# EasyEDA Pro project v0.9.0.epro, board PCB5_10
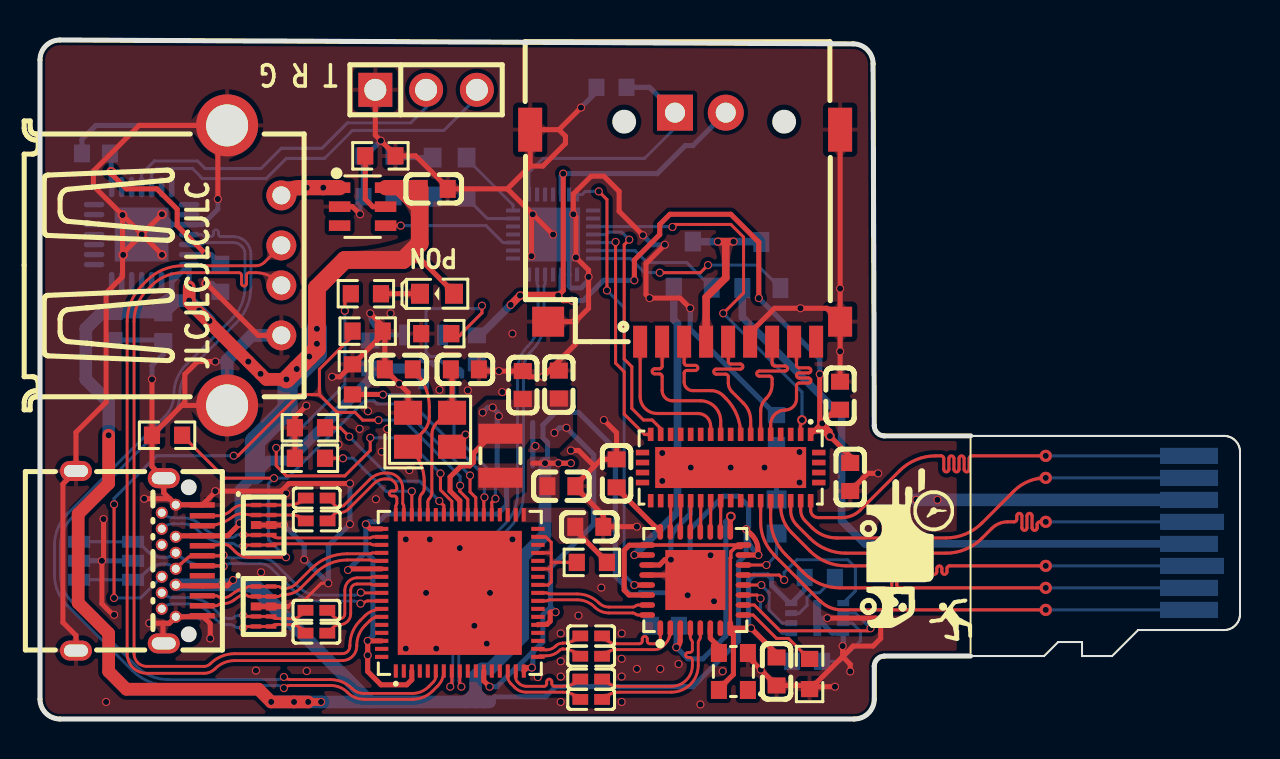
[diagram p2: board, top side]
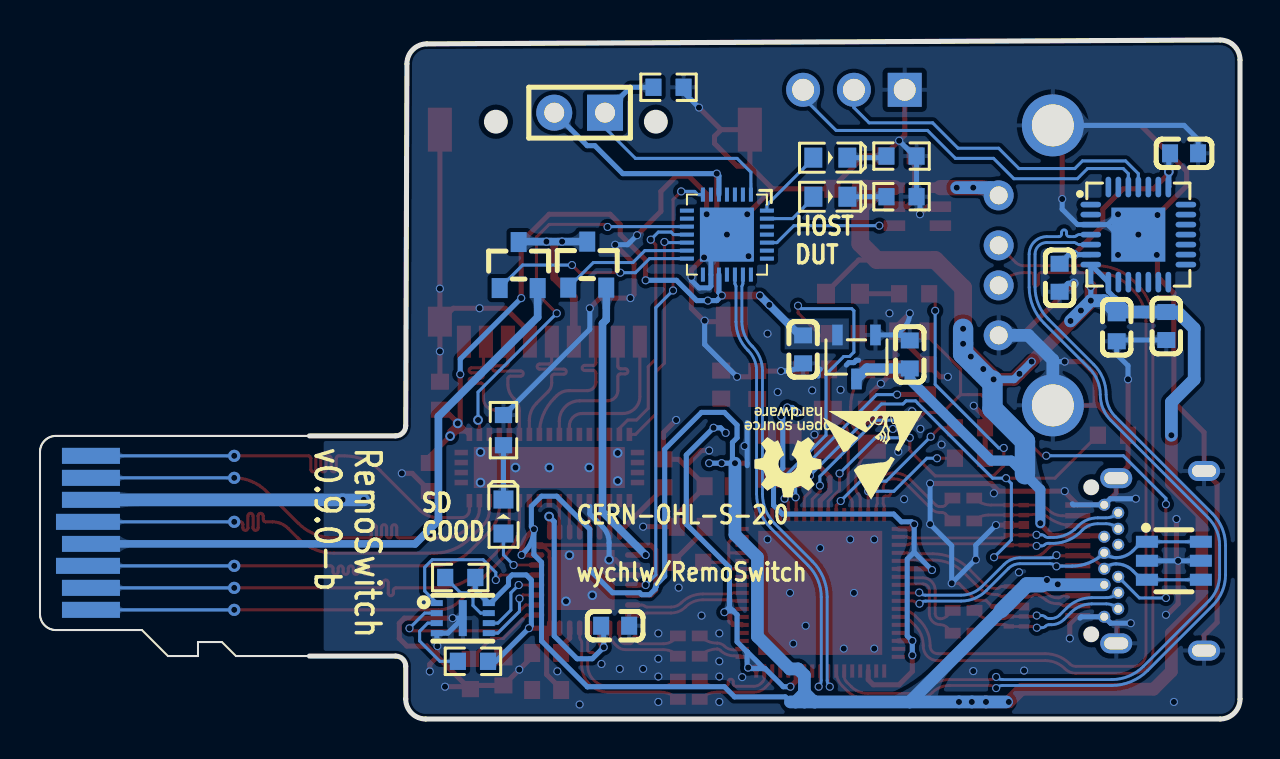
[diagram p3: board, bottom side, seen from below]

Outline 60.01 x 33.95 mm; copper layers: Top Layer, 内层1, 内层2, Bottom Layer. Coordinates in mm from the lower left corner of the outline.
Outline path: 46.53,14.16 42.23,14.16 arc(41.87,14.3) 41.72,14.66 41.66,32.76 arc(41.37,33.46) 40.66,33.76 1,33.95 arc(0.29,33.66) 0,32.95 0,1 arc(0.29,0.29) 1,0 40.72,0 arc(41.43,0.29) 41.72,1 41.72,2.64 arc(41.87,3) 42.23,3.15 46.53,3.15
Stack: Top Layer 0.035mm 外层铜厚1oz / Dielectric1 0.0994mm 3313 RC57% 4.2mil / 内层1 0.0152mm 内层铜厚 / Dielectric2 0.5mm 0.5mm H/HOZ 不含铜  / 内层2 0.0152mm 内层铜厚 / Dielectric3 0.0994mm 3313 RC57% 4.2mil / Bottom Layer 0.035mm 外层铜厚1oz

## Design rules (mm)
net RD_TX+: RD_TX
net RD_TX-: RD_TX
net RD_RX+: RD_RX
net RD_RX-: RD_RX
net RD_D-: RD_D
net RD_D+: RD_D
net HS_D-: HS_D
net HS_D+: HS_D
net SER_D-: SER_D
net SER_D+: SER_D
net UP_D-: UP_D
net UP_D+: UP_D
net UP_TX2-: UP_TX2
net UP_RX2+: UP_RX2
net UP_TX2+: UP_TX2
net UP_RX2-: UP_RX2
net UP_TX1-: UP_TX1
net UP_TX1+: UP_TX1
net BRD_D+: BRD_D
net BRD_D-: BRD_D
net UP_RX1+: UP_RX1
net UP_RX1-: UP_RX1
net $2N12812: DP1
net $2N12808: DP1
net $2N12884: DP2
net $2N12880: DP2
net $2N14098: DP4
net $2N14097: DP4
net $2N14148: DP3
net $2N14147: DP3
template: 自定义配置
spacing copperThickness1oz (default): track to track 0.102, other pairs 0.102 to 0.3
spacing copperThickness2oz: track to track 0.203, other pairs 0.152 to 0.3
track width copperThickness1oz (default): min 0.127, default 0.254, max 2.54
track width copperThickness2oz: min 0.203, default 0.254, max 2.54
track width TFP: min 0.157, default 0.157, max 0.157
differential pair differentialPair (default): width min 0.127, default 0.142, max 0.152; gap min 0.152, default 0.152
differential pair differentialPair3.0: width min 0.127, default 0.142, max 0.152; gap min 0.152, default 0.152
differential pair differentialPair4: width min 0.127, default 0.142, max 2.54; gap min 0.152, default 0.152
via viaSize (default): diameter min 0.356, default 0.404, max 10; hole min 0.3, default 0.305, max 6.299
net RD_TX+ uses differentialPair3.0
net RD_TX- uses differentialPair3.0
net TF_DAT1 uses TFP, TF_MUX
net TF_DAT0 uses TFP, TF_MUX
net TF_CLK uses TFP, TF_MUX
net TF_CMD uses TFP, TF_MUX
net TF_DAT3 uses TFP, TF_MUX
net TF_DAT2 uses TFP, TF_MUX
net RD_RX+ uses differentialPair3.0
net RD_RX- uses differentialPair3.0
net UP_DAT1 uses MUX_TS, TFP
net UP_DAT0 uses MUX_TS, TFP
net UP_CLK uses MUX_TS, TFP
net UP_CMD uses MUX_TS, TFP
net UP_DAT3 uses MUX_TS, TFP
net UP_DAT2 uses MUX_TS, TFP
net TS_DAT1 uses MUX_DUT, TFP
net TS_DAT0 uses MUX_DUT, TFP
net TS_CLK uses MUX_DUT, TFP
net TS_CMD uses MUX_DUT, TFP
net TS_DAT3 uses MUX_DUT, TFP
net TS_DAT2 uses MUX_DUT, TFP
net UP_D- uses differentialPair4
net UP_D+ uses differentialPair4
net UP_TX2- uses differentialPair3.0
net UP_RX2+ uses differentialPair3.0
net UP_TX2+ uses differentialPair3.0
net UP_RX2- uses differentialPair3.0
net UP_TX1- uses differentialPair3.0
net UP_TX1+ uses differentialPair3.0
net UP_RX1+ uses differentialPair3.0
net UP_RX1- uses differentialPair3.0
net $2N12812 uses differentialPair3.0
net $2N12808 uses differentialPair3.0
net $2N12884 uses differentialPair3.0
net $2N12880 uses differentialPair3.0
net $2N14098 uses differentialPair3.0
net $2N14097 uses differentialPair3.0
net $2N14148 uses differentialPair3.0
net $2N14147 uses differentialPair3.0
diff pair RD_TX uses differentialPair3.0
diff pair RD_RX uses differentialPair3.0
diff pair UP_D uses differentialPair4
diff pair UP_TX2 uses differentialPair3.0
diff pair UP_RX2 uses differentialPair3.0
diff pair UP_TX1 uses differentialPair3.0
diff pair UP_RX1 uses differentialPair3.0
diff pair DP1 uses differentialPair3.0
diff pair DP2 uses differentialPair3.0
diff pair DP4 uses differentialPair3.0
diff pair DP3 uses differentialPair3.0

## Placement (name value [footprint] x y rotation side)
C36  100nF  [C0603]  28.83 12.28 90 top
C41  100nF  [C0603]  36.83 2.38 270 top
C42  100nF  [C0603]  31.25 4.66 0 bottom
C45  100nF  [C0603]  40.01 16.16 270 top
C46  100nF  [C0603]  40.52 12.1 90 top
C74  100nF  [C0402]  13.82 5.44 0 top
C75  100nF  [C0402]  13.82 4.29 0 top
C84  100nF  [C0603]  6.16 19.59 90 bottom
C85  100nF  [C0603]  3.69 19.65 270 bottom
C86  100nF  [C0603]  2.8 28.28 0 bottom
C92  10uF  [C0603]  19.69 26.51 0 top
C93  10uF  [C0603]  21.85 18.48 90 bottom
C94  10uF  [C0603]  16.51 18.23 270 bottom
C95  100nF  [C0603]  9.02 22.06 90 bottom
C96  1uF  [C0603]  26.07 11.64 0 top
C97  1uF  [C0603]  24.14 16.7 90 top
C98  10uF  [C0603]  25.95 16.72 90 top
C99  1uF  [C0603]  27.47 9.61 0 top
C100  20pF  [C0603]  17.94 17.48 0 top
C101  20pF  [C0603]  21.25 17.48 0 top
C102  100nF  [C0402]  13.84 11.05 0 top
C103  100nF  [C0402]  13.84 9.9 0 top
C104  100nF  [C0402]  27.56 2 0 top
C105  100nF  [C0402]  27.56 0.98 0 top
C106  100nF  [C0402]  27.56 4.16 0 top
C107  100nF  [C0402]  27.56 3.14 0 top
CARD1  TF PUSH  [TF-SMD_TF-PUSH]  32.26 24.17 180 top
H2  -  [HDR-TH_3P-P2.54-V-M]  19.31 31.46 0 top
H4  -  [HDR-TH_2P-P2.54-V-M-1]  33.02 30.32 0 bottom
L2  2.2uH  [IND-SMD_L2.5-W2.0_MHCHL2520]  23.02 13.16 90 top
LED11  LED-0603_R  [LED0603_RED]  36.83 10.12 90 bottom
LED12  LED-0603_R  [LED0603_RED]  20.48 26.11 180 bottom
LED13  LED-0603_R  [LED0603_RED]  20.49 28.07 180 bottom
LED15  LED-0603_R  [LED0603_RED]  19.85 21.26 180 top
Q2  AO3401A  [SOT-23_L2.9-W1.3-P1.90-LS2.4-BR]  32.64 22.72 270 bottom
Q3  AO3401A  [SOT-23_L2.9-W1.3-P1.90-LS2.4-BR]  36.07 22.7 270 bottom
R26  680  [R0603]  38.48 2.25 90 top
R39  1K  [R0603]  16.93 28.15 180 bottom
R40  1K  [R0603]  16.93 26.11 180 bottom
R41  10K  [R0603]  28.58 31.59 180 bottom
R43  22K  [R0603]  17.02 28.16 180 top
R44  1K  [R0603]  36.83 14.44 90 bottom
R52  1K  [R0603]  27.6 7.83 180 top
R54  1K  [R0603]  16.3 21.26 180 top
R55  10K  [R0603]  13.5 13.04 180 top
R56  10K  [R0603]  13.5 14.56 180 top
R57  5.1K  [R0603]  16.39 19.39 0 top
R58  5.1K  [R0603]  6.35 14.19 180 top
R59  5.1K  [R0603]  15.62 16.98 90 top
R62  10K  [R0603]  38.36 2.88 0 bottom
R63  10K  [R0603]  38.99 7.08 180 bottom
R64  NC  [R0603]  19.82 19.27 180 top
U2  GL3224-OIY04  [HQFN-32_L5.0-W5.0-P0.50-BL-EP3.0]  32.77 6.95 0 top
U3  TS3DV642A0RUAR  [WFQFN-42_L9.0-W3.5-P0.50-BL-EP]  34.54 12.57 180 top
U9  TF卡插头  [TF卡封装]  57.53 9.31 180 top
U23  ESD7104MUTAG  [DFN-10_L2.5-W1.0-P0.50-BL]  11.18 5.63 270 top
U24  ESD7104MUTAG  [DFN-10_L2.5-W1.0-P0.50-BL]  11.19 9.7 270 top
U25  USBLC6-2SC6-ES  [SOT-23-6_L2.9-W1.6-P0.95-LS2.8-BR]  3.31 7.91 0 bottom
U27  CH32V203G6U6  [QFN-28_L4.0-W4.0-P0.40-BL-EP2.7]  25.66 24.22 0 bottom
U29  CH217K  [SOT-23-6_L2.9-W1.6-P0.95-LS2.8-BL]  16.13 25.62 270 top
U30  ME6210A33M3G  [SOT-23-3_L3.0-W1.7-P0.95-LS2.9-BR]  19.18 18.1 90 bottom
U31  CH9102X  [TQFN-28_L5.0-W5.0-P0.50-BL-EP2.7]  5.08 24.22 270 bottom
U33  CH634X  [QFN-68_L8.0-W8.0-P0.40-BL-EP6.2]  20.99 6.31 0 top
U34  W25X20CLUXIG-TR  [USON8_L3.0-W2.0-P0.50-TL-EP]  38.87 5.04 180 bottom
USB2  -  [USB_ Type-A]  6.61 22.7 270 top
USB3  TYPE-C 24P QCHT  [TYPE-C-SMD_TYPE-C-24P-QCHT]  4.96 7.91 270 top
X6  25MHz  [OSC-SMD_4P-L2.5-W2.0-BL-1]  34.67 2.38 90 top
X10  24MHz  [CRYSTAL-SMD_4P-L3.2-W2.5-BL]  19.51 14.46 0 top

## Footprints (pads in the part's own frame, mm; a bottom-side part is the same pattern mirrored in y, then rotated)
C0402
  rect 0.79x0.54 smd: 1(-0.545,0) 2(0.545,0)
C0603
  rect 0.8x0.9 smd: 1(-0.7,0) 2(0.7,0)
CRYSTAL-SMD_4P-L3.2-W2.5-BL
  rect 1.4x1.2 smd: 1(-1.1,-0.85) 2(1.1,-0.85) 3(1.1,0.85) 4(-1.1,0.85)
DFN-10_L2.5-W1.0-P0.50-BL
  rect 0.22x0.52 smd: 1(-1,-0.381) 2(-0.5,-0.381) 4(0.5,-0.381) 5(1,-0.381) 6(1,0.381) 7(0.5,0.381) 9(-0.5,0.381) 10(-1,0.381)
  rect 0.4x0.52 smd: 3(0,-0.381) 8(0,0.381)
HDR-TH_2P-P2.54-V-M-1
  rect 1.8x1.8 hole 1: 1(-1.27,0)
  round 1.8 hole 1: 2(1.27,0)
HDR-TH_3P-P2.54-V-M
  rect 1.7x1.7 hole 1.1: 1(-2.54,0)
  round 1.7 hole 1.1: 2(0,0) 3(2.54,0)
HQFN-32_L5.0-W5.0-P0.50-BL-EP3.0
  oval 0.28x0.785 smd: 1(-1.75,-2.408) 2(-1.25,-2.408) 3(-0.75,-2.408) 4(-0.25,-2.408) 5(0.25,-2.408) 6(0.75,-2.408) 7(1.25,-2.408) 8(1.75,-2.408) 17(1.75,2.408) 18(1.25,2.408) 19(0.75,2.408) 20(0.25,2.408) 21(-0.25,2.408) 22(-0.75,2.408) 23(-1.25,2.408) 24(-1.75,2.408)
  oval 0.785x0.28 smd: 9(2.408,-1.75) 10(2.408,-1.25) 11(2.408,-0.75) 12(2.408,-0.25) 13(2.408,0.25) 14(2.408,0.75) 15(2.408,1.25) 16(2.408,1.75) 25(-2.408,1.75) 26(-2.408,1.25) 27(-2.408,0.75) 28(-2.408,0.25) 29(-2.408,-0.25) 30(-2.408,-0.75) 31(-2.408,-1.25) 32(-2.408,-1.75)
  rect 3x3 smd: 33(0,0)
IND-SMD_L2.5-W2.0_MHCHL2520
  rect 1x2.2 smd: 1(-1.1,0) 2(1.1,0)
LED0603_RED
  rect 0.9x1 smd: 1(-0.85,0) 2(0.85,0)
OSC-SMD_4P-L2.5-W2.0-BL-1
  rect 0.9x0.8 smd: 1(-0.925,-0.725) 2(0.925,-0.725) 3(0.925,0.725) 4(-0.925,0.725)
QFN-28_L4.0-W4.0-P0.40-BL-EP2.7
  rect 0.2x0.7 smd: 1(-1.2,-2) 2(-0.8,-2) 3(-0.4,-2) 4(-0.001,-2) 5(0.4,-2) 6(0.8,-2) 7(1.2,-2) 15(1.2,2) 16(0.8,2) 17(0.4,2) 18(0,2) 19(-0.4,2) 20(-0.8,2) 21(-1.2,2)
  rect 0.7x0.2 smd: 8(2,-1.2) 9(2,-0.8) 10(2,-0.4) 11(1.999,0) 12(2,0.4) 13(2,0.8) 14(2,1.2) 22(-2,1.2) 23(-2,0.8) 24(-2,0.4) 25(-2,0) 26(-2,-0.4) 27(-2,-0.8) 28(-2,-1.2)
  rect 2.7x2.7 smd: 29(0.001,0)
QFN-68_L8.0-W8.0-P0.40-BL-EP6.2
  rect 0.2x0.665 smd: 1(-3.2,-3.908) 2(-2.8,-3.908) 3(-2.4,-3.908) 4(-2,-3.908) 5(-1.6,-3.908) 6(-1.2,-3.908) 7(-0.8,-3.908) 8(-0.4,-3.908) 9(0,-3.908) 10(0.4,-3.908) 11(0.8,-3.908) 12(1.2,-3.908) 13(1.6,-3.908) 14(2,-3.908) 15(2.4,-3.908) 16(2.8,-3.908) 17(3.2,-3.908) 35(3.2,3.908) 36(2.8,3.908) 37(2.4,3.908) 38(2,3.908) 39(1.6,3.908) 40(1.2,3.908) 41(0.8,3.908) 42(0.4,3.908) 43(0,3.908) 44(-0.4,3.908) 45(-0.8,3.908) 46(-1.2,3.908) 47(-1.6,3.908) 48(-2,3.908) 49(-2.4,3.908) 50(-2.8,3.908) 51(-3.2,3.908)
  rect 0.665x0.2 smd: 18(3.908,-3.2) 19(3.908,-2.8) 20(3.908,-2.4) 21(3.908,-2) 22(3.908,-1.6) 23(3.908,-1.2) 24(3.908,-0.8) 25(3.908,-0.4) 26(3.908,0) 27(3.908,0.4) 28(3.908,0.8) 29(3.908,1.2) 30(3.908,1.6) 31(3.908,2) 32(3.908,2.4) 33(3.908,2.8) 34(3.908,3.2) 52(-3.908,3.2) 53(-3.908,2.8) 54(-3.908,2.4) 55(-3.908,2) 56(-3.908,1.6) 57(-3.908,1.2) 58(-3.908,0.8) 59(-3.908,0.4) 60(-3.908,0) 61(-3.908,-0.4) 62(-3.908,-0.8) 63(-3.908,-1.2) 64(-3.908,-1.6) 65(-3.908,-2) 66(-3.908,-2.4) 67(-3.908,-2.8) 68(-3.908,-3.2)
  rect 6.2x6.2 smd: 69(0,0)
R0603
  rect 0.806x0.864 smd: 1(-0.753,0) 2(0.753,0)
SOT-23-3_L3.0-W1.7-P0.95-LS2.9-BR
  rect 1.038x0.532 smd: 1(1.101,-0.95) 2(1.101,0.95) 3(-1.101,0)
SOT-23-6_L2.9-W1.6-P0.95-LS2.8-BL
  rect 0.532x1.072 smd: 1(-0.95,-1.149) 2(0,-1.149) 3(0.95,-1.149) 4(0.95,1.149) 5(0,1.149) 6(-0.95,1.149)
SOT-23-6_L2.9-W1.6-P0.95-LS2.8-BR
  rect 1.1x0.6 smd: 1(1.35,-0.95) 2(1.35,0) 3(1.35,0.95) 4(-1.35,0.95) 5(-1.35,0) 6(-1.35,-0.95)
SOT-23_L2.9-W1.3-P1.90-LS2.4-BR
  rect 1x0.8 smd: 1(1.15,-0.95) 2(1.15,0.95) 3(-1.15,0)
TF-SMD_TF-PUSH
  rect 0.7x1.6 smd: 1(2.25,5.3) 2(1.15,5.3) 3(0.05,5.3) 4(-1.05,5.3) 5(-2.15,5.3) 6(-3.25,5.3) 7(-4.35,5.3) 8(-5.45,5.3) CD(-6.55,5.3)
  rect 1.2x1.5 smd: 10(-7.75,4.3)
  rect 1.2x2.2 smd: 11(-7.75,-5.3) 12(7.75,-5.3)
  rect 1.6x1.5 smd: 13(6.85,4.3)
TF卡封装
  rect 2.9x0.8 smd far side: 1(0.075,3.85) 2(0.074,2.751) 4(0.075,0.551) 6(0.074,-1.651) 7(0.074,-2.751) 8(0.074,-3.85)
  rect 3.2x0.8 smd far side: 3(-0.074,1.65) 5(-0.075,-0.551)
TQFN-28_L5.0-W5.0-P0.50-BL-EP2.7
  oval 0.28x1.03 smd: 1(-1.5,-2.377) 2(-1,-2.377) 3(-0.5,-2.377) 4(0,-2.377) 5(0.5,-2.377) 6(1,-2.377) 7(1.5,-2.377) 15(1.5,2.377) 16(1,2.377) 17(0.5,2.377) 18(0,2.377) 19(-0.5,2.377) 20(-1,2.377) 21(-1.5,2.377)
  oval 1.03x0.28 smd: 8(2.377,-1.5) 9(2.377,-1) 10(2.377,-0.5) 11(2.377,0) 12(2.377,0.5) 13(2.377,1) 14(2.377,1.5) 22(-2.377,1.5) 23(-2.377,1) 24(-2.377,0.5) 25(-2.377,0) 26(-2.377,-0.5) 27(-2.377,-1) 28(-2.377,-1.5)
  rect 2.7x2.7 smd: 29(0,0)
TYPE-C-SMD_TYPE-C-24P-QCHT
  oval 1x1.6 hole 0.6x1.2: 25(-4.49,-3.158) 25(-4.13,1.232) 25(4.13,1.232) 25(4.49,-3.158)
  rect 0.275x1.25 smd: A1(-2.79,3.158) A2(-2.25,3.158) A3(-1.75,3.158) A4(-1.25,3.158) A5(-0.75,3.158) A6(-0.25,3.158) A7(0.25,3.158) A8(0.75,3.158) A9(1.25,3.158) A10(1.75,3.158) A11(2.25,3.158) A12(2.75,3.158)
  round 0.6 hole 0.4: B1(2.8,1.833) B2(2.4,1.133) B3(1.601,1.133) B4(1.2,1.833) B5(0.8,1.133) B6(0.4,1.833) B7(-0.4,1.833) B8(-0.8,1.133) B9(-1.2,1.833) B10(-1.6,1.133) B11(-2.4,1.133) B12(-2.8,1.833)
USB_ Type-A
  round 1.5 hole 0.9: 1(-3.484,5.461) 2(-0.984,5.461) 3(1.016,5.461) 4(3.516,5.461)
  round 3.1 hole 2.1: SH1(7.016,2.751) SH2(-6.984,2.751)
USON8_L3.0-W2.0-P0.50-TL-EP
  rect 0.6x0.3 smd: 1(-1.3,0.75) 2(-1.3,0.25) 3(-1.3,-0.25) 4(-1.3,-0.75) 5(1.3,-0.75) 6(1.3,-0.25) 7(1.3,0.25) 8(1.3,0.75)
  rect 0.4x1.8 smd: 9(0,0)
WFQFN-42_L9.0-W3.5-P0.50-BL-EP
  rect 0.28x0.665 smd: 1(-3.998,-1.657) 2(-3.498,-1.657) 3(-2.998,-1.657) 4(-2.498,-1.657) 5(-1.998,-1.657) 6(-1.498,-1.657) 7(-0.998,-1.657) 8(-0.497,-1.657) 9(0.003,-1.657) 10(0.502,-1.657) 11(1.002,-1.657) 12(1.502,-1.657) 13(2.002,-1.657) 14(2.502,-1.657) 15(3.002,-1.657) 16(3.502,-1.657) 17(4.003,-1.657) 22(4.003,1.657) 23(3.502,1.657) 24(3.002,1.657) 25(2.502,1.657) 26(2.002,1.657) 27(1.502,1.657) 28(1.002,1.657) 29(0.502,1.657) 30(0.003,1.657) 31(-0.497,1.657) 32(-0.998,1.657) 33(-1.498,1.657) 34(-1.998,1.657) 35(-2.498,1.657) 36(-2.998,1.657) 37(-3.498,1.657) 38(-3.998,1.657)
  rect 0.665x0.28 smd: 18(4.41,-0.75) 19(4.41,-0.25) 20(4.41,0.25) 21(4.41,0.75) 39(-4.405,0.75) 40(-4.405,0.25) 41(-4.405,-0.25) 42(-4.405,-0.75)
  rect 7.55x2.05 smd: 43(0.003,0)

## Nets
As in the schematic.

Pads without a net: CARD1 CD; U2 7; U3 3 4 9 12 13 14 15 18 19 20 21 22 23 30 31 32 39 40 41 42; U27 4 6 15 18 21 22 23 25 26; U29 3; U31 1 2 9 10 11 12 13 14 15 16 17 18 19 20 21 23 24 27 28; U33 1 2 4 5 10 11 13 14 20 21 23 24 28 30 32 34 38 46 64 65 67 68; USB3 A8 B8; X6 1

## Via types
v1: diameter 0.404, hole 0.305, Top Layer to Bottom Layer, 192 vias
v2: diameter 0.482, hole 0.305, Top Layer to Bottom Layer, 23 vias
v3: diameter 0.61, hole 0.305, Top Layer to Bottom Layer, 6 vias

## Routing (per net, layer and track width the routed paths; a pad name or vN(x,y) marks a point on that pad's centre or on a via; arc(x,y) is an arc through that point)
+5V: length 193.2
  Top Layer w0.254: LED15.1 20.7,21.31 19.06,22.95 18.16,22.95 ; USB3.A4 6.84,9.16 USB3.B9 ; USB3.B4 6.84,6.66 9.37,6.66 v1(9.66,6.95) ; 24.64,12.79 v1(25.25,12.79) v1(25.92,12.79) v1(26.55,12.79) ; 17.6,26.57 18.8,25.36 ; U2.15 v1(35.92,8.2) 35.9,8.22 35.9,8.46 arc(35.82,8.86) 35.6,9.2 v1(35.31,9.49) ; 10.02,9.79 9.4,9.17 9.17,9.17 arc(9.12,9.17) 9.08,9.16 8.11,9.16
  Top Layer w0.381: v1(14.05,0.85) v1(13.41,0.85)
  Top Layer w0.635: v1(7.46,21.61) 7.46,20.83 v1(10.42,17.87) v1(11.03,17.26) 11.31,16.98 v1(12.32,16.98) ; v1(3.43,14.19) 3.43,11.77 1.91,10.25 1.91,5.81 3.43,4.28 3.43,2.38 4.32,1.49 10.93,1.49 v1(11.56,0.85) v1(12.7,0.85) v1(13.41,0.85)
  Top Layer w0.762: 18.04,26.57 18.67,25.94 18.67,25.87 ; 18.04,26.57 U29.6 ; 18.04,26.57 18.93,26.57 C92.1
  Top Layer w0.889: C92.1 18.99,23.77 18.16,22.95 15.24,22.95 13.85,21.55 v1(13.85,19.51) v1(13.85,18.76) 13.85,18.51 v1(13.46,18.12) v1(12.84,17.5) v1(12.32,16.98)
  Bottom Layer w0.254: v1(35.31,9.49) 35.44,9.62 35.44,10.63 34.93,11.14 34.17,11.14 32.52,9.49 32.52,7.46 31.37,6.31 30.02,6.31 29.92,6.22 29.52,6.22 29.24,6.5 29.24,6.57 29.19,6.62 29.19,6.72 28.77,7.14 28.77,13.49 26.93,15.33 25.78,15.33 25.15,14.7 25.15,14.06 25.38,13.83 25.38,12.92 v1(25.25,12.79) v1(25.92,12.79) v1(26.55,12.79) ; v1(35.31,9.49) 35.31,8.22 34.93,7.84 34.93,3.9 32.64,1.61 32.63,1.61 25.78,1.61 25.28,1.11 22.74,1.11 22.48,0.85 ; v1(35.31,9.49) arc(35.43,8.87) 35.79,8.34 v1(35.92,8.2) ; 6.1,20.92 6.23,21.05 6.26,21.05 6.58,21.38 U31.8 U31.7 v1(7.46,21.61) v1(7.46,20.92) ; 6.1,20.92 6.8,20.92 ; 6.1,20.92 arc(6.15,20.9) 6.16,20.85 C84.2 ; 9.77,6.71 9.77,6.84 v1(9.66,6.95)
  Bottom Layer w0.381: v1(12.32,16.98) 11.31,16.98 v1(11.03,17.26) v1(10.42,17.87) ; 6.1,20.92 5.53,20.35
  Bottom Layer w0.508: U30.3 18.65,17.53 C94.2 16.51,16.98 12.45,12.92 11.43,12.92 10.75,12.24 9.99,11.47 v1(9.99,9.79)
  Bottom Layer w0.635: USB3.B4 9.91,6.71 ; v1(8.48,19.9) v1(7.96,20.42) v1(7.46,20.92) 6.8,20.92 C84.2 6.1,20.35 C85.1 3.12,20.35 2.29,19.52 2.29,16.98 3.43,15.84 v1(3.43,14.19) ; 21.78,0.85 21.26,0.85 ; 21.78,0.85 22.22,0.85 ; 21.78,0.85 21.78,1.31 ; 21.26,0.85 16.51,0.85 ; 21.26,0.85 arc(21.26,0.86) 21.27,0.86 21.33,0.86 21.78,1.31 ; 21.78,1.38 21.78,2.19 22.1,2.5 22.51,2.5 24.13,4.13 24.13,8.09 25.25,9.21 v1(25.25,12.79) ; 21.78,1.38 21.78,1.31 ; 21.78,1.38 arc(21.8,1.29) 21.85,1.22 22.22,0.85 ; 16.51,0.85 11.94,5.42 ; 16.51,0.85 v1(14.05,0.85) v1(13.41,0.85) v1(12.7,0.85) 11.69,0.85 ; 22.22,0.85 22.48,0.85
  Bottom Layer w0.762: 11.94,5.42 10.65,6.71 9.91,6.71
  Bottom Layer w1.016: 10.75,12.24 10.75,13.89 12.38,15.51 12.38,16.93 ; 12.58,16.98 13.85,18.25 v1(13.85,18.76) v1(13.85,19.51)
  vias: v1(9.11,6.73)
GND: length 297
  Top Layer w0.152: 12.4,5.63 12.7,5.93 13.21,5.93 14.06,6.79 v1(14.42,6.79)
  Top Layer w0.254: v1(21.28,14.22) 20.67,13.61 X10.2 ; v1(12.2,9.7) U24.8 U24.3 ; 6.49,11.01 USB3.B12 8.1,10.71 8.11,10.7 8.77,11.35 v1(8.77,11.39) 12.07,11.39 12.45,11.77 v1(15.5,11.77) ; 6.49,11.01 6.19,11.31 USB3.25 5.6,12.63 R58.2 ; 6.49,11.01 v1(5.21,11.01) ; v2(8.31,21.78) 10.91,19.18 12.07,19.18 ; R55.2 R56.2 12.75,15.09 v1(13.32,15.66) ; 25.46,17.42 v1(25.15,17.11) 24.43,17.11 C97.2 v1(22.95,17.4) 22.03,17.4 C101.2 ; 25.46,17.42 26.76,18.72 26.76,19.87 ; 25.46,17.42 C98.2 ; v1(39.75,1.61) 38.63,1.61 ; 38.63,1.61 40.14,3.12 ; 38.63,1.61 38.51,1.5 38.48,1.5 ; 38.63,1.61 38.6,1.61 38.48,1.5 ; v1(16.51,20.28) 17.14,19.66 17.14,19.39 ; v1(3.18,10) 3.18,7.99 v1(3.1,7.91) 3.1,5.76 3.56,5.3 ; U2.27 30.98,7.7 31.25,7.97 v2(31.55,7.97) 31.75,7.97 32.52,7.2 ; CARD1.13 26.76,19.87 ; 26.76,19.87 27.43,20.54 v1(27.43,22.11) 27.43,22.45 v1(26.8,23.08) 26.8,25.11 v1(26.67,25.24) 26.67,26.25 27.56,27.14 28.2,27.14 28.96,26.38 28.96,25.38 v1(30.15,24.19) ; v1(29.85,9.62) 28.18,9.62 C99.2 28.17,10.19 26.77,11.59 C96.2 26.77,11.69 27.72,12.64 ; H2.1 16.77,29.19 v1(17.05,28.92) 17.77,28.19 R43.1 18.79,28.16 20.39,26.56 C92.2 23.37,26.51 ; v1(16.01,25.24) 15.62,25.62 U29.2 ; R58.2 v1(5.6,16.98) ; R58.2 7.09,15.68 ; 7.09,15.68 7.24,15.83 7.24,17.24 7.88,17.87 v1(8.77,17.87) ; 7.09,15.68 9.36,15.68 ; v2(6.1,25.24) 5.09,24.23 ; 5.09,24.23 6.1,23.23 v2(6.1,23.2) ; 5.09,24.23 v2(4.13,25.2) ; 5.09,24.23 v2(5.08,24.22) 4.16,23.3 v2(4.16,23.2) ; v1(39.37,5.04) 41.79,5.04 42.04,4.79 42.04,4.03 41.66,3.65 40.66,3.65 40.14,3.12 ; v1(25.66,24.22) v1(24.64,25.24) ; v1(24.64,25.24) 24.58,25.17 v1(24.58,23.14) ; v1(24.64,25.24) 23.37,26.51 ; v1(8.89,26) 8.89,29.22 9.36,29.68 4.95,29.68 2.67,27.4 2.67,26.66 v2(4.13,25.2) ; 40.14,3.12 v1(40.14,3.65) ; 40.14,3.12 40.52,2.74 v1(40.52,2.38) ; USB3.25 1.8,4.18 1.15,4.83 1.15,11.75 USB3.25 1.8,14.33 3.31,15.84 3.31,21.3 4.13,22.12 v2(4.13,25.2) ; 12.4,5.63 U23.8 U23.3 ; USB3.25 6.15,3.82 6.15,4.79 ; 38.48,1.5 38.3,1.68 C41.2 v1(36.04,2.47) 35.4,3.11 X6.2 ; CARD1.6 35.51,19.32 36.73,20.54 v1(38.03,20.54) 39.34,20.54 CARD1.10 ; 17.14,19.39 17.14,19.22 15.65,17.74 R59.2 15,17.11 v1(14.61,17.11) ; 17.14,19.39 17.24,19.29 C100.1 v1(17.96,16.77) 18.41,16.32 X10.4 ; CARD1.10 v1(40.01,18.38) 40.01,16.87 C45.1 ; CARD1.10 v1(40.01,21.52) CARD1.11 ; 6.15,4.79 v1(5.46,4.79) ; 6.15,4.79 6.47,4.79 USB3.B1 8.06,5.11 8.11,5.16 8.51,4.76 v1(8.51,4.03) ; v1(26.55,13.43) 26.94,13.43 27.72,12.64 ; 25.95,29.47 26.28,29.14 26.28,28.78 25.15,27.65 24.51,27.65 ; 25.95,29.47 v1(27.05,30.57) ; 25.95,29.47 CARD1.12 24.51,27.65 ; 24.51,27.65 23.37,26.51 ; 27.72,12.64 28.07,12.98 28.83,12.98 28.83,14.31 v1(28.2,14.95) ; v1(32.52,20.54) 32.01,21.05 v1(30.48,21.05) 30.3,21.23 30.3,22.77 v1(31.25,23.71) ; 32.52,7.2 U2.33 ; 32.52,7.2 U2.28 ; v1(41.91,12.28) 41.4,12.28 C46.1
  Bottom Layer w0.254: v1(32.52,20.54) 32.52,19.48 36.8,15.2 R44.2 ; 4.78,7.91 v1(3.1,7.91) 2.08,7.91 ; v1(12.2,9.7) 13.21,8.69 v1(13.21,7.96) 13.24,7.96 v1(14.42,6.79) 14.42,8.66 v1(15.5,9.74) v1(15.5,11.77) ; v1(5.21,11.01) 6.49,11.01 USB3.B12 8.34,10.71 8.39,10.76 ; R41.2 27.83,31.34 v1(27.05,30.57) ; v1(30.15,24.19) 30.63,23.71 v1(31.25,23.71) ; v1(25.66,24.22) 26.46,23.42 U27.16 26.46,21.64 26.55,21.55 27.05,21.55 27.43,21.93 v1(27.43,22.11) ; 6.62,24.72 6.12,24.22 v2(5.08,24.22) ; 6.62,24.72 v2(6.1,25.24) ; 6.62,24.72 U31.3 8.12,24.72 8.89,25.49 v1(8.89,26) ; v1(39.37,5.04) U34.9 39.61,4.29 U34.4 40.17,3.68 v1(40.14,3.65) ; v2(31.55,7.97) 31.55,8.82 arc(31.64,9.25) 31.88,9.62 32.52,10.25 32.52,10.63 ; 24.64,12.66 24.64,14.82 ; C86.1 2.1,28.98 2.8,29.68 9.36,29.68 ; v2(8.31,21.78) 8.6,21.78 C95.1 ; v1(8.77,17.87) 9.27,17.87 ; 19.07,17.94 19.19,17.94 19.31,17.82 19.56,17.82 19.68,17.7 ; v1(5.6,16.98) 5.6,17.67 6.16,18.23 C84.1 6.1,18.95 C85.2 ; 20.99,17.49 21.09,17.39 21.09,17.14 ; 8,5.04 7.94,5.11 USB3.B1 6.47,4.79 5.59,4.79 ; v1(16.01,25.24) 16.01,25.95 R40.2 R39.2 16.27,28.15 v1(17.05,28.92) ; v1(26.77,19.92) 26.77,18.73 v1(25.15,17.11) ; 17.18,19.2 U30.1 ; 17.18,19.2 16.81,19.57 arc(16.59,19.9) v1(16.51,20.28) ; 17.18,19.2 arc(16.82,19.13) C94.1 ; v1(22.95,17.4) 22.77,17.4 arc(22.27,17.5) C93.1
  Bottom Layer w0.635: v1(43.82,10.96) v1(44.88,10.96) U9.6 ; 9.36,15.68 9.36,17.95 10.58,19.18 12.07,19.18
  vias: v1(3.31,0.85) v1(3.7,5.21) v1(10.8,2.42) v1(11.05,7.34) v1(12.31,11.28) v1(13.34,2.4) v1(14.92,13.72) v1(15.98,14.51) v1(16.4,15.39) v1(16.8,10.99) v1(17.09,13.36) v1(17.36,14.5) v1(17.53,20.28) v1(18.29,8.98) v1(18.29,3.52) v1(18.47,12.44) v1(19.31,6.31) v1(19.49,8.98) v1(19.82,3.52) v1(19.98,16.46) v1(20.99,8.55) v1(21.39,16.43) v1(21.72,4.66) v1(22.34,3.77) v1(22.5,6.31) v1(23.12,16.35) v1(23.63,19.27) v1(23.63,8.98) v1(24.77,13.65) v1(24.89,2.09) v1(26.04,4.28) v1(26.04,2.88) v1(26.04,2.12) v1(26.04,0.85) v1(26.93,5.17) v1(28.07,6.57) v1(29.09,4.28) v1(29.09,3.01) v1(29.09,2.12) v1(29.09,0.85) v1(29.85,2.5) v1(31.02,2.5) v1(31.93,2.75) v1(33.02,0.73) v1(34.14,2.39) v2(31.12,13.3) v2(31.12,11.9) v2(32.39,6.19) v2(32.54,12.57) v2(33.53,8.19) v2(33.7,5.89) v2(34.54,12.57) v2(36.23,12.57) v2(37.98,13.35) v2(37.98,11.82)
VCC: length 54.2
  Top Layer w0.254: v1(29.72,21.94) 29.72,22.95 30.99,24.22 30.99,24.73 31.5,25.24 34.55,25.24 35.94,23.84 v1(35.94,21.05) ; v1(26.61,20.92) 26.17,20.92 v1(25.91,21.17) 26.17,21.43 v1(26.17,27.27) ; v2(39.12,14.78) 39.09,14.78 ; v2(39.12,14.78) 39.1,14.8 ; v2(39.12,14.78) 39.12,14.43 ; v2(39.12,14.78) 39.5,14.4 ; 39.09,14.78 38.71,14.4 ; 39.09,14.78 39.1,14.8 ; C45.2 39.77,15.46 39.1,14.8 ; 39.1,14.8 38.99,14.91 v1(38.99,17.24) ; 39.12,14.43 39.09,14.4 ; 39.12,14.43 39.15,14.4 ; 39.09,14.4 38.71,14.4 ; 39.09,14.4 39.15,14.4 ; 38.71,14.4 U3.1 ; 39.15,14.4 39.5,14.4 ; 39.15,14.4 39.4,14.14 v2(39.5,14.14) ; v2(39.5,14.14) 40.52,13.13 C46.2 ; v2(39.5,14.14) 39.5,14.4
  Top Layer w0.381: v1(25.91,21.17) v1(24.01,21.17) v1(23.54,20.7)
  Top Layer w0.508: 39.12,14.81 v2(39.12,14.78)
  Bottom Layer w0.254: H4.2 32.64,28.67 32.26,28.67 30.86,27.27 v1(26.17,27.27) 26.06,27.16 U27.5 ; v1(35.94,21.05) 38.99,18 v1(38.99,17.24) ; v1(29.72,21.94) 28.18,21.94 27.16,20.92 v1(26.61,20.92) 26.17,20.92 v1(25.91,21.17) 26.06,21.32 U27.17
  Bottom Layer w0.381: v1(24.01,21.17) v1(23.54,20.7) 22.02,19.18 C93.2
25CLKIN: length 1.4
  Top Layer w0.254: U2.6 33.52,4.04 33.95,3.61 X6.3
BOOT0: length 13
  Bottom Layer w0.152: U27.1 24.46,27.34 25.15,28.03 30.23,28.03 31.75,29.55 H4.1
  Bottom Layer w0.254: 29.33,31.59 30.48,31.59 H4.1
BRD_D+: length 40.9
  Top Layer w0.142: 12.07,21.68 11.88,21.87 arc(11.39,22.2) 10.8,22.32 10.46,22.32 arc(10.37,22.28) 10.33,22.19 10.33,21.77 arc(10.2,21.64) 10.08,21.77 10.08,22.19 arc(10.04,22.28) 9.95,22.32 7.12,22.32 arc(6.29,22.15) 5.59,21.68 5.34,21.44 arc(4.87,20.72) 4.7,19.88 4.7,3.27 arc(4.89,2.82) 5.34,2.63 8.21,2.63 arc(8.37,2.66) 8.51,2.76 arc(9.08,3.13) 9.74,3.27 15.12,3.27 arc(15.39,3.38) 15.5,3.65 15.5,3.69 arc(15.63,4.35) 16.01,4.92 16.25,5.16 arc(16.6,5.4) 17.02,5.48 arc(17.05,5.49) U33.62
BRD_D-: length 41
  Top Layer w0.142: 12.07,23.68 11.23,22.84 arc(11.03,22.71) 10.8,22.66 7.12,22.66 arc(6.16,22.47) 5.35,21.93 5.1,21.68 arc(4.55,20.86) 4.36,19.88 4.36,3.27 arc(4.64,2.57) 5.34,2.29 8.21,2.29 arc(8.5,2.35) 8.76,2.51 arc(9.21,2.81) 9.74,2.92 15.12,2.92 arc(15.63,3.13) 15.84,3.65 15.84,3.69 arc(15.95,4.22) 16.25,4.67 16.49,4.91 arc(16.73,5.08) 17.02,5.13 arc(17.05,5.13) U33.63
BRD_PWR: length 5.3
  Top Layer w0.762: U29.1 v1(14.17,26.57) v1(13.34,26.57) 13,26.57 arc(12.5,26.47) 12.07,26.18
  Bottom Layer w0.635: 12.07,26.18 12.45,26.57 v1(13.34,26.57) v1(14.17,26.57)
BRD_PWR_EN: length 6.8
  Top Layer w0.152: 17.53,24.6 17.46,24.67 ; 17.46,24.67 v1(18.04,24.67) ; 17.46,24.67 U29.4
  Bottom Layer w0.152: v1(18.04,24.67) 22.31,24.67 23.15,23.82 23.66,23.82
CC1: length 29.4
  Top Layer w0.152: v1(21.51,12.17) 21.51,11.35 21.79,11.07 U33.41 ; v1(12.3,8.09) 10.44,8.09 arc(10.07,8.16) 9.76,8.37 9.53,8.6 arc(9.39,8.69) 9.22,8.73 9.02,8.73 arc(8.57,8.68) 8.11,8.66 ; 8.56,8.62 8.58,8.62 ; R58.1 9.25,12.04 v1(11.7,12.04)
  Bottom Layer w0.152: 16.12,15.8 16.22,15.91 16.7,15.91 16.85,15.75 17.93,15.75 v1(21.51,12.17) ; v1(12.3,8.09) 11.43,8.96 11.43,11.77 v1(11.7,12.04) 12.37,12.04 16.12,15.79
CC2: length 34.9
  Top Layer w0.152: v1(9.69,13.16) 9.9,13.16 12.96,16.22 13.59,16.22 13.6,16.22 13.97,16.22 ; v1(3.7,10.73) 3.7,6.06 arc(3.7,6.05) v1(3.7,6.05) ; 13.97,16.22 13.97,17.49 15.63,19.15 R57.1 ; 13.97,16.22 14.86,15.33 15.75,15.33 16.14,14.94 v1(16.93,14.94) ; U33.42 21.39,10.99 20.99,11.39 20.99,11.65 v1(21.01,11.67)
  Bottom Layer w0.152: v1(16.93,14.94) 18.2,14.94 21.01,12.13 v1(21.01,11.67) ; v1(3.7,6.05) 5.03,6.05 USB3.B5 ; v1(9.69,13.16) 5.84,13.16 3.7,11.03 v1(3.7,10.73)
CTRL_TS_LED: length 2.8
  Bottom Layer w0.152: 23.66,25.02 22.38,25.02 21.33,26.06 LED12.1
CTRL_UP_LED: length 3.6
  Bottom Layer w0.152: U27.28 23.66,25.7 21.34,28.02 LED13.1
DOWN_VCC_EN: length 6.7
  Bottom Layer w0.152: U27.13 29.76,23.42 30.36,22.82 32.34,22.82 Q2.1
HS_D+: length 22.9
  Top Layer w0.142: U33.8 20.59,1.8 arc(20.57,1.7) v1(20.51,1.61)
  Bottom Layer w0.142: U27.20 24.86,21.77 arc(24.86,21.73) 24.88,21.7 arc(24.9,21.67) 24.91,21.64 24.91,19.86 arc(24.78,19.21) 24.41,18.65 24.39,18.63 arc(24.01,18.07) 23.88,17.41 23.88,11.25 arc(23.72,10.44) 23.26,9.76 21.39,7.89 arc(20.84,7.06) 20.64,6.09 20.64,1.93 arc(20.61,1.76) v1(20.51,1.61)
HS_D-: length 22.9
  Top Layer w0.142: U33.9 20.99,1.8 arc(21.01,1.7) v1(21.07,1.61)
  Bottom Layer w0.142: U27.19 25.26,21.77 arc(25.25,21.73) 25.23,21.7 arc(25.21,21.67) 25.2,21.64 25.2,19.86 arc(25.05,19.1) 24.62,18.45 24.6,18.42 arc(24.28,17.96) 24.17,17.41 24.17,11.25 arc(23.99,10.33) 23.47,9.55 21.6,7.68 arc(21.11,6.95) 20.94,6.09 20.94,1.93 arc(20.97,1.76) v1(21.07,1.61)
HUB_1V2: length 56.9
  Top Layer w0.254: U33.43 20.99,10.92 20.51,11.4 20.51,12.1 21.06,12.66 21.49,12.66 21.68,12.85 21.68,13.29 22.65,14.26 L2.2 ; U33.3 18.59,1.96 18.34,1.71 17.05,1.71 16.39,2.38 v1(16.39,3.19) v1(16.39,3.91) U33.66 ; U33.17 24.36,2.57 v1(24.59,2.57) ; v1(16.29,9.73) 16.52,9.51 U33.52 ; v1(25.78,5.34) 25.54,5.34 25.51,5.32 25.51,4.89 25.35,4.73 24.92,4.73 U33.22 ; v1(22.48,1.61) 22.19,1.91 U33.12 ; v1(15.4,7.45) 15.46,7.51 U33.57
  Bottom Layer w0.254: 25.73,5.4 25.33,5.4 ; 25.73,5.4 v1(25.78,5.34) ; 25.73,5.4 25.53,5.59 ; 25.33,5.4 25.15,5.21 25.15,3.86 24.64,3.35 24.64,3.35 ; 25.33,5.4 25.53,5.59 ; 16.29,8.34 16.64,7.99 16.64,4.16 v1(16.39,3.91) v1(16.39,3.19) ; 16.29,8.34 v1(15.4,7.45) ; 16.29,8.34 v1(16.29,9.73) 16.42,9.86 16.93,9.86 17.32,10.25 22.89,10.25 23.33,10.69 23.33,12.07 22.86,12.54 22.86,15.06 v1(22.95,15.14) 22.95,15.27 v1(22.64,15.58) 22.39,15.58 v1(22.14,15.32) ; 24.64,3.35 24.69,3.39 24.69,3.39 ; 24.64,3.35 24.64,2.52 ; 24.64,3.35 24.63,3.35 23.82,2.53 23.82,2.52 ; 25.53,5.59 25.53,7.58 27.69,9.74 27.69,13.2 v1(26.33,14.56) 25.98,14.56 v1(25.72,14.31) ; 24.64,2.52 23.82,2.52 ; 24.64,2.52 v1(24.59,2.57) ; 23.81,2.52 23.82,2.52 ; 23.82,2.52 23.75,2.52 22.84,1.61 v1(22.48,1.61)
HUB_3V3: length 2.4
  Top Layer w0.254: C99.1 26.77,9.44 28.35,7.86 R52.1
HUB_XI: length 8.2
  Top Layer w0.152: C100.2 18.72,17.4 arc(19.28,16.58) 19.47,15.61 19.47,15.12 arc(19.39,14.71) 19.15,14.36 X10.1 18.57,13.45 arc(19.05,12.74) 19.21,11.89 19.21,11.53 arc(19.19,11.4) 19.11,11.29 arc(19.02,11.15) 18.99,10.99 U33.48
HUB_XO: length 7.8
  Top Layer w0.152: U33.47 19.39,10.84 arc(19.41,10.94) 19.47,11.02 arc(19.56,11.16) 19.6,11.33 19.6,14.2 arc(19.66,14.53) 19.85,14.81 20.16,15.13 arc(20.37,15.27) X10.3
  Top Layer w0.254: X10.3 20.61,17.34 arc(20.59,17.42) C101.1
MUX_EN: length 19.8
  Top Layer w0.152: v1(31.63,24.6) 31.75,24.73 34.55,24.73 35.18,24.09 35.18,21.3 v1(34.17,20.28) ; U3.2 arc(38.02,14.59) v2(38.1,14.95)
  Bottom Layer w0.152: U27.10 31.61,24.62 v1(31.63,24.6) ; v1(34.17,20.28) 38.1,16.35 v2(38.1,14.95)
RD_1V2: length 12.2
  Top Layer w0.254: v2(34.55,10.12) 34.52,10.1 U2.17 ; 32.01,4.62 32.01,3.92 arc(31.98,3.76) 31.89,3.62
  Bottom Layer w0.254: v2(34.55,10.12) 34.29,9.87 34.29,4.16 33.15,3.01 32.39,3.01 v1(31.82,3.59) 31.82,4.54 C42.2
RD_D+: length 5.7
  Top Layer w0.142: U2.32 29.9,5.2 arc(29.83,5.21) 29.78,5.25 arc(29.72,5.29) 29.65,5.3 28.45,5.3 arc(28.06,5.38) 27.73,5.6 arc(27.34,5.87) 26.86,5.96 25.46,5.96 arc(25.43,5.95) 25.4,5.93 arc(25.37,5.91) 25.34,5.91 U33.25
RD_D-: length 5.7
  Top Layer w0.142: U2.31 29.9,5.7 arc(29.83,5.69) 29.78,5.65 arc(29.72,5.61) 29.65,5.6 28.45,5.6 arc(28.18,5.65) 27.94,5.81 arc(27.45,6.14) 26.86,6.25 25.46,6.25 arc(25.43,6.26) 25.4,6.28 arc(25.37,6.3) 25.34,6.31 U33.26
RD_RX+: length 7.6
  Top Layer w0.142: U2.4 32.52,4.08 arc(32.53,4.01) 32.57,3.96 arc(32.61,3.9) 32.62,3.83 32.62,3.45 arc(32.58,3.36) 32.49,3.33 32.41,3.33 arc(32.28,3.2) 32.41,3.07 32.49,3.07 arc(32.58,3.04) 32.62,2.95 32.62,2.68 arc(32.32,1.94) 31.58,1.64 28.98,1.64 arc(28.51,1.73) C104.2
RD_RX-: length 7.6
  Top Layer w0.142: U2.5 33.02,4.08 arc(33.01,4.01) 32.97,3.96 arc(32.93,3.9) 32.92,3.83 32.92,2.68 arc(32.52,1.73) 31.58,1.34 28.98,1.34 arc(28.51,1.25) C105.2
RD_TX+: length 4.2
  Top Layer w0.142: C106.2 28.27,4 arc(28.53,3.82) 28.83,3.76 29.99,3.76 arc(30.08,3.8) 30.11,3.89 30.11,4.01 arc(30.24,4.13) 30.37,4.01 30.37,3.89 arc(30.4,3.8) 30.49,3.76 30.74,3.76 arc(30.85,3.78) 30.94,3.84 arc(31,3.93) 31.02,4.04 U2.1
RD_TX-: length 4.2
  Top Layer w0.142: C107.2 28.15,3.19 arc(28.47,3.39) 28.83,3.47 30.74,3.47 arc(30.96,3.51) 31.15,3.63 31.25,3.74 arc(31.45,4.04) 31.52,4.39 U2.2
RD_VCC: length 30.2
  Top Layer w0.178: U2.25 U2.16 35.06,8.58 34.77,8.58 34.54,8.36 34.54,8.07 34.52,8.04 U2.8
  Top Layer w0.254: U2.25 30.35,8.69 29.47,8.69 29.21,8.44 29.21,6.44 29.46,6.2 U2.30 ; C41.1 36.83,3.27 v1(35.56,4.54) U2.8 34.67,4.39 34.67,2.23 33.95,1.5 X6.4
  Bottom Layer w0.254: R63.2 38.24,6.47 U34.8 37.48,5.79 36.58,6.69 36.58,7.02 36.4,7.2 35.69,7.2 35.44,6.95 35.44,4.66 v1(35.56,4.54) 37.21,2.88 R62.1
SEL0: length 12.9
  Top Layer w0.152: v1(29.47,23.97) 29.21,23.71 29.21,18 29.59,17.62 29.59,15.53 30.17,14.95 30.61,14.95 31.04,14.53 U3.16
  Bottom Layer w0.152: v1(29.47,23.97) 29.09,24.35 28.45,24.35 28.32,24.22 U27.11
SEL1: length 11.7
  Top Layer w0.152: v1(28.78,23.85) 28.78,17.79 29.21,17.36 29.21,15.25 30.23,14.23 U3.17
  Bottom Layer w0.152: v1(28.78,23.85) 28.75,23.82 27.66,23.82
SER_D+: length 45.8
  Top Layer w0.142: U33.6 19.79,2.14 arc(19.76,1.99) 19.67,1.85 19.43,1.61 arc(19.06,1.37) 18.62,1.28 16.2,1.28 arc(15.87,1.35) 15.59,1.53 arc(15.11,1.86) 14.53,1.97 12.51,1.97 arc(12.34,2) v1(12.2,2.1)
  Bottom Layer w0.142: U31.4 8.05,24.22 arc(8.11,24.21) 8.17,24.17 arc(8.23,24.13) 8.29,24.12 8.54,24.12 arc(8.63,24.16) 8.67,24.25 8.67,24.33 arc(8.8,24.46) 8.92,24.33 8.92,24.25 arc(8.96,24.16) 9.05,24.12 9.67,24.12 arc(10.29,23.86) 10.54,23.24 10.54,21.59 arc(10.35,20.62) 9.8,19.79 7.53,17.52 arc(7.13,16.92) 6.99,16.22 arc(6.85,15.52) 6.45,14.92 1.59,10.06 arc(1.17,9.43) 1.02,8.68 1.02,7.2 arc(1.16,6.5) 1.56,5.9 4.83,2.63 arc(5.56,2.14) 6.42,1.97 11.88,1.97 arc(12.05,2) v1(12.2,2.1)
SER_D-: length 45.8
  Top Layer w0.142: v1(12.2,1.55) arc(12.34,1.64) 12.51,1.68 14.53,1.68 arc(14.99,1.58) 15.38,1.32 arc(15.76,1.07) 16.2,0.98 18.62,0.98 arc(19.18,1.09) 19.64,1.41 19.88,1.64 arc(20.11,1.99) U33.7
  Bottom Layer w0.142: U31.5 8.05,23.72 arc(8.11,23.73) 8.17,23.77 arc(8.23,23.81) 8.29,23.82 9.67,23.82 arc(10.08,23.65) 10.25,23.24 10.25,21.59 arc(10.08,20.73) 9.59,20 7.32,17.73 arc(6.86,17.04) 6.69,16.22 arc(6.58,15.63) 6.24,15.13 1.38,10.27 arc(0.9,9.54) 0.72,8.68 0.72,7.2 arc(0.89,6.39) 1.35,5.69 4.62,2.42 arc(5.45,1.87) 6.42,1.68 11.88,1.68 arc(12.05,1.64) v1(12.2,1.55)
SPI_CK: length 3.7
  Top Layer w0.152: U2.12 v1(36.07,6.7)
  Bottom Layer w0.152: U34.6 37.11,4.79 36.46,5.45 36.46,6.31 v1(36.07,6.7)
SPI_CS: length 8.5
  Top Layer w0.152: U2.13 36.96,7.2 v1(37.21,6.95)
  Bottom Layer w0.152: U34.1 40.77,6.4 40.77,7.58 40.39,7.96 37.85,7.96 37.21,7.33 v1(37.21,6.95)
SPI_MISO: length 8.6
  Top Layer w0.152: v1(41.53,4.54) 41.41,4.41 37.01,4.41 35.72,5.7 U2.10
  Bottom Layer w0.152: v1(41.53,4.54) 40.77,5.29 U34.2
SPI_MOSI: length 3.6
  Top Layer w0.152: v1(36.03,6.02) 35.86,6.2 U2.11
  Bottom Layer w0.152: v1(36.03,6.02) 36.03,5.38 37.11,4.29 U34.5
SUSP_PDHUB#: length 22.9
  Top Layer w0.152: U33.44 20.59,10.88 20.03,11.45 v1(20.03,12.27) ; R54.2 15.24,20.96 v1(15.24,20.41) ; v1(16.51,14.06) 16.51,13.43 15.24,12.16 12.32,12.16 11.81,12.66 v1(11.81,13.55)
  Bottom Layer w0.152: v1(20.03,12.27) 18.24,14.06 v1(16.51,14.06) ; v1(11.81,13.55) 12.07,13.55 15.24,16.73 v1(15.24,20.41)
TF_CLK: length 7.6
  Top Layer w0.158: U3.7 35.54,14.93 arc(35.45,15.39) 35.18,15.78 34.6,16.37 arc(34.47,16.57) 34.42,16.8 34.42,17.11 arc(34.38,17.2) 34.29,17.24 33.82,17.24 arc(33.69,17.37) 33.82,17.5 35.02,17.5 arc(35.15,17.62) 35.02,17.75 34.55,17.75 arc(34.46,17.79) 34.42,17.88 34.42,18.84 arc(34.42,18.86) CARD1.5
TF_CMD: length 7.6
  Top Layer w0.158: CARD1.3 32.21,17.81 arc(32.25,17.72) 32.34,17.68 32.77,17.68 arc(32.9,17.55) 32.77,17.43 32.34,17.43 arc(32.25,17.39) 32.21,17.3 32.21,16.85 arc(32.34,16.55) 32.64,16.42 33.55,16.42 arc(33.88,16.35) 34.17,16.16 34.29,16.04 arc(34.84,15.21) 35.04,14.24 U3.8
TF_DAT0: length 7.5
  Top Layer w0.158: CARD1.7 36.61,17.78 arc(36.65,17.69) 36.74,17.65 37.25,17.65 arc(37.38,17.52) 37.25,17.4 35.97,17.4 arc(35.84,17.27) 35.97,17.14 36.48,17.14 arc(36.57,17.11) 36.61,17.02 36.61,16.73 arc(36.54,16.35) 36.33,16.04 36.29,16 arc(36.1,15.72) 36.04,15.4 U3.6
TF_DAT1: length 7.6
  Top Layer w0.158: U3.5 36.54,14.72 arc(36.75,15.24) 37.26,15.45 arc(37.67,15.61) 37.83,16.02 37.83,16.67 arc(37.87,16.76) 37.96,16.8 38.43,16.8 arc(38.55,16.92) 38.43,17.05 37.96,17.05 arc(37.83,17.18) 37.96,17.3 38.43,17.3 arc(38.55,17.43) 38.43,17.56 37.96,17.56 arc(37.87,17.6) 37.83,17.69 37.83,18.36 arc(37.81,18.48) 37.74,18.57
TF_DAT2: length 7.5
  Top Layer w0.158: CARD1.1 30.01,16.13 arc(30.26,15.53) 30.86,15.28 32.9,15.28 arc(33.35,15.09) 33.54,14.64 U3.11
TF_DAT3: length 7.7
  Top Layer w0.158: CARD1.2 31.11,17.64 arc(31.07,17.55) 30.98,17.51 30.74,17.51 arc(30.61,17.38) 30.74,17.26 30.98,17.26 arc(31.07,17.22) 31.11,17.13 31.11,16.43 arc(31.26,16.06) 31.63,15.91 33.02,15.91 arc(33.74,15.61) 34.04,14.89 34.04,14.23
TF_VCC: length 9.6
  Top Layer w0.381: v1(33.9,23.87) v1(34.68,23.87) ; 34.29,23.84 34.29,22.06 33.31,21.08 CARD1.4
  Bottom Layer w0.381: 32.64,23.87 v1(33.9,23.87) v1(34.68,23.87) 36.05,23.87 Q3.3
TS_CLK: length 24.9
  Top Layer w0.158: v3(50.3,9.86) 49.99,9.86 arc(49.9,9.82) 49.86,9.73 49.86,9.56 arc(49.74,9.43) 49.61,9.56 49.61,10.16 arc(49.48,10.28) 49.36,10.16 49.36,9.56 arc(49.23,9.43) 49.1,9.56 49.1,10.16 arc(48.97,10.28) 48.85,10.16 48.85,9.98 arc(48.81,9.9) 48.72,9.86 48.39,9.86 arc(47.96,9.77) 47.6,9.53 47.1,9.03 arc(46.28,8.48) 45.31,8.29 40.3,8.29 arc(39.33,8.48) 38.5,9.03 37.85,9.69 arc(37.62,10.03) 37.54,10.44 U3.36
  Bottom Layer w0.158: U9.5 v3(50.3,9.86)
TS_CMD: length 24.9
  Top Layer w0.158: U3.35 37.04,10.65 arc(37.18,9.92) 37.59,9.31 38.5,8.4 arc(39.33,7.85) 40.3,7.66 43.45,7.66 arc(43.54,7.62) 43.58,7.53 43.58,7.36 arc(43.7,7.23) 43.83,7.36 43.83,7.53 arc(43.96,7.66) 44.08,7.53 44.08,7.36 arc(44.21,7.23) 44.34,7.36 44.34,7.53 arc(44.46,7.66) 44.59,7.53 44.59,7.36 arc(44.72,7.23) 44.85,7.36 44.85,7.53 arc(44.97,7.66) 45.1,7.53 45.1,7.36 arc(45.23,7.23) 45.35,7.36 45.35,7.53 arc(45.39,7.62) 45.48,7.66 v3(50.3,7.66)
  Bottom Layer w0.158: U9.3 v3(50.3,7.66)
TS_DAT0: length 24.9
  Top Layer w0.158: U3.37 38.04,10.45 arc(38.1,10.16) 38.26,9.91 38.61,9.56 arc(39.17,9.19) 39.84,9.05 42.04,9.05 arc(42.13,9.09) 42.17,9.18 42.17,9.59 arc(42.3,9.72) 42.42,9.59 42.42,9.18 arc(42.55,9.05) 42.68,9.18 42.68,9.59 arc(42.8,9.72) 42.93,9.59 42.93,9.18 arc(43.06,9.05) 43.19,9.18 43.19,9.59 arc(43.31,9.72) 43.44,9.59 43.44,9.18 arc(43.48,9.09) 43.57,9.05 45.31,9.05 arc(46.28,9.25) 47.1,9.8 48.7,11.4 arc(49.43,11.89) v3(50.3,12.06)
  Bottom Layer w0.158: U9.7 v3(50.3,12.06)
TS_DAT1: length 24.9
  Top Layer w0.158: U3.38 38.54,10.45 arc(38.65,10.18) 38.92,10.07 40.1,10.07 arc(40.6,10.17) 41.02,10.45 42.99,12.41 arc(43.81,12.96) 44.78,13.16 45.07,13.16 arc(45.16,13.12) 45.2,13.03 45.2,12.48 arc(45.32,12.35) 45.45,12.48 45.45,13.03 arc(45.58,13.16) 45.7,13.03 45.7,12.48 arc(45.83,12.35) 45.96,12.48 45.96,13.03 arc(46.08,13.16) 46.21,13.03 46.21,12.48 arc(46.34,12.35) 46.46,12.48 46.46,13.03 arc(46.5,13.12) 46.59,13.16 v3(50.3,13.16)
  Bottom Layer w0.158: U9.8 v3(50.3,13.16)
TS_DAT2: length 24.7
  Top Layer w0.158: U3.33 36.04,9.83 arc(36.21,8.96) 36.71,8.22 36.71,8.2 39.01,5.89 39.03,5.89 arc(39.52,5.57) 40.08,5.46 v3(50.3,5.46)
  Bottom Layer w0.158: U9.1 v3(50.3,5.46)
TS_DAT3: length 24.9
  Top Layer w0.158: U3.34 36.54,10.02 arc(36.73,9.05) 37.28,8.22 38.2,7.3 arc(39.03,6.75) 40,6.56 42.21,6.56 arc(42.3,6.52) 42.34,6.43 42.34,6.29 arc(42.46,6.16) 42.59,6.29 42.59,6.82 arc(42.72,6.95) 42.85,6.82 42.85,6.68 arc(42.88,6.59) 42.97,6.56 v3(50.3,6.56)
  Bottom Layer w0.158: U9.2 v3(50.3,6.56)
TS_RXD: length 17.8
  Bottom Layer w0.152: 19.31,31.84 19.31,30.57 18.55,29.81 15.37,29.81 14.1,28.54 12.07,28.54 11.05,27.52 8.26,27.52 7.88,27.9 5.72,27.9 5.08,27.27 U31.25
TS_TXD: length 19.7
  Bottom Layer w0.152: U31.26 5.58,27.27 5.84,27.52 7.62,27.52 8.13,27.02 11.31,27.02 12.32,28.03 14.23,28.03 15.62,29.43 20.2,29.43 21.85,31.08 21.85,31.84
TS_VCC: length 31.5
  Bottom Layer w0.381: Q3.2 35.12,20.09 40.08,15.13 40.08,9.92 41.25,8.76 U9.4
TTL_VCC: length 10.3
  Top Layer w0.254: v2(3.56,27.36) 3.56,27.27 4.32,26.51 5.85,26.51 6.86,25.49 6.86,24.67 v2(8.31,23.22)
  Bottom Layer w0.254: U31.6 v2(8.31,23.22) 8.56,23.22 C95.2 ; U31.22 3.56,26.62 v2(3.56,27.36) 3.56,28.09
UP_CHO: length 22.2
  Top Layer w0.152: v1(28.35,21.43) 28.35,25.97 v1(27.94,26.38)
  Top Layer w0.254: U2.29 v1(29.72,6.7)
  Bottom Layer w0.152: v1(29.72,6.7) 29.21,7.21 29.21,20.57 v1(28.35,21.43) ; v1(27.94,26.38) 27.27,26.38 27.11,26.22 U27.7
UP_CLK: length 1.6
  Top Layer w0.158: U3.27 33.04,9.36
UP_CMD: length 1.6
  Top Layer w0.158: U3.26 32.54,9.36
UP_D+: length 16.4
  Top Layer w0.142: U33.60 16.08,6.31 arc(16.06,6.31) v1(16.04,6.32)
  Top Layer w0.158: USB3.B6 arc(7.07,7.78) 7.37,8.04 arc(7.73,8.2) 8.11,8.16 9.11,8.16 arc(9.15,8.17) v1(9.18,8.19)
  Bottom Layer w0.142: v1(16.04,6.32) arc(15.9,6.23) 15.73,6.19 13.95,6.19 arc(13.38,6.3) 12.9,6.62 11.79,7.73 arc(11.43,7.97) 11,8.06 9.49,8.06 arc(9.32,8.09) v1(9.18,8.19)
  Bottom Layer w0.158: 2.08,6.96 U25.3 ; U25.3 4.78,6.96 ; U25.3 arc(4.89,7.01) 5.08,7.14 5.35,7.41 arc(5.74,7.67) 6.2,7.76 arc(6.52,7.69) USB3.B6
UP_D-: length 17.3
  Top Layer w0.142: U33.61 16.4,5.91 arc(16.3,5.89) 16.23,5.84 arc(16.15,5.78) 16.06,5.77 v1(16.03,5.77)
  Top Layer w0.158: 8.11,7.66 9.11,7.66 arc(9.15,7.65) v1(9.18,7.63)
  Bottom Layer w0.142: v1(16.03,5.77) arc(15.88,5.86) 15.71,5.9 13.95,5.9 arc(13.27,6.03) 12.69,6.42 11.59,7.52 arc(11.32,7.7) 11,7.76 9.49,7.76 arc(9.32,7.73) v1(9.18,7.63)
  Bottom Layer w0.158: 9,7.64 8.4,7.64 arc(7.53,7.82) USB3.B7 arc(6.52,8.13) 6.2,8.07 arc(5.74,8.16) 5.35,8.42 5.08,8.69 arc(4.89,8.82) U25.1 ; U25.1 4.78,8.86 ; U25.1 2.08,8.86
UP_DAT0: length 1.6
  Top Layer w0.158: U3.28 33.54,9.36
UP_DAT1: length 1.6
  Top Layer w0.158: U3.29 34.04,9.36
UP_DAT2: length 1.6
  Top Layer w0.158: U3.24 31.54,9.36
UP_DAT3: length 1.6
  Top Layer w0.158: U3.25 32.04,9.36
UP_LED: length 2.9
  Top Layer w0.152: U2.14 v1(36.33,7.7)
  Bottom Layer w0.152: LED11.1 36.83,8.21 v1(36.33,7.7)
UP_RX1+: length 11.5
  Top Layer w0.142: U33.53 16.65,9.11 arc(16.61,9.1) 16.58,9.08 arc(16.55,9.06) 16.52,9.05 11.92,9.05 arc(11.73,9.09) U24.7 U24.4 10.2,9.2 arc(10.19,9.2) v1(10.17,9.21) ; 10.26,9.2 arc(10.21,9.21) 10.17,9.23
  Bottom Layer w0.142: v1(10.17,9.21) 9.92,9.21 arc(9.84,9.19) 9.76,9.14 arc(9.69,9.1) 9.61,9.08 9.51,9.08 arc(8.84,9.16) 8.26,9.49 8.09,9.65 arc(7.65,9.95) 7.12,10.06 6.7,10.06 arc(6.37,10.12) USB3.B11
UP_RX1-: length 11.4
  Top Layer w0.142: U33.54 16.65,8.71 arc(16.61,8.71) 16.58,8.73 arc(16.55,8.75) 16.52,8.76 11.71,8.76 arc(11.63,8.74) U24.6 U24.5 10.28,8.7 arc(10.22,8.69) v1(10.17,8.65)
  Bottom Layer w0.142: v1(10.17,8.65) 9.92,8.65 arc(9.83,8.67) 9.76,8.72 arc(9.69,8.77) 9.6,8.78 9.51,8.78 arc(8.73,8.89) 8.05,9.28 7.89,9.44 arc(7.53,9.68) 7.12,9.76 6.7,9.76 arc(6.37,9.7) USB3.B10
UP_RX2+: length 9.8
  Top Layer w0.142: U33.56 16.63,7.91 arc(16.6,7.91) 16.57,7.93 arc(16.55,7.95) 16.52,7.95 15.36,7.95 arc(14.51,7.78) 13.79,7.3 13.05,6.56 arc(12.67,6.31) 12.23,6.22 12.14,6.22 arc(12.08,6.21) 12.03,6.17 arc(11.97,6.14) 11.91,6.13 U23.9 U23.2 10.47,6.13 arc(10.4,6.14) 10.35,6.18 arc(10.29,6.22) 10.22,6.23 10.22,6.23 arc(10.13,6.22) 10.06,6.19 arc(9.88,6.07) 9.71,5.95 arc(9.44,5.81) 9.15,5.76 9.06,5.76 arc(8.99,5.75) 8.93,5.71 arc(8.88,5.67) 8.81,5.66 8.11,5.66
UP_RX2-: length 9.8
  Top Layer w0.142: 8.11,6.16 8.81,6.16 arc(8.88,6.15) 8.93,6.11 arc(8.99,6.07) 9.06,6.06 9.15,6.06 arc(9.35,6.09) 9.53,6.19 arc(9.72,6.32) 9.91,6.44 arc(10.06,6.5) 10.22,6.52 arc(10.29,6.54) 10.35,6.57 arc(10.4,6.61) 10.47,6.63 U23.1 U23.10 11.91,6.63 arc(11.97,6.61) 12.03,6.58 arc(12.08,6.54) 12.14,6.53 12.23,6.53 arc(12.55,6.6) 12.83,6.78 13.57,7.52 arc(14.39,8.07) 15.36,8.26 16.52,8.26 arc(16.55,8.27) 16.57,8.28 arc(16.6,8.3) 16.63,8.31 U33.55
UP_TX1+: length 5.4
  Top Layer w0.142: 8.11,10.16 8.87,10.16 arc(9.26,10.24) 9.6,10.46 arc(9.86,10.64) 10.16,10.7 U24.1 U24.10 12.45,10.7 arc(12.9,10.79) C102.1
UP_TX1-: length 5.4
  Top Layer w0.142: 8.11,9.66 arc(8.93,9.75) 9.66,10.12 arc(9.9,10.24) 10.16,10.25 arc(10.48,10.21) U24.2 U24.9 12.58,10.2 arc(12.97,10.12) C103.1
UP_TX2+: length 7.8
  Top Layer w0.142: C75.1 13.03,4.54 arc(12.83,4.67) 12.6,4.72 arc(12.33,4.73) 12.07,4.73 11.81,4.73 arc(11.67,4.7) U23.6 U23.5 10.31,4.63 arc(10.23,4.61) v1(10.16,4.56)
  Bottom Layer w0.142: v1(10.16,4.56) 9.91,4.56 arc(9.81,4.58) 9.73,4.64 arc(9.64,4.69) 9.55,4.71 9.44,4.71 arc(9.09,4.78) 8.8,4.98 8.45,5.33 arc(7.97,5.65) 7.42,5.76 6.68,5.76 arc(6.36,5.69) USB3.B2
UP_TX2-: length 7.8
  Top Layer w0.142: C74.1 13.03,5.19 arc(12.83,5.06) 12.6,5.01 arc(12.33,5.02) 12.07,5.02 11.81,5.02 arc(11.67,5.05) U23.7 U23.4 10.28,5.13 arc(10.22,5.14) v1(10.17,5.17)
  Bottom Layer w0.142: v1(10.17,5.17) 9.91,5.17 arc(9.82,5.15) 9.73,5.1 arc(9.65,5.04) 9.55,5.02 9.44,5.02 arc(9.21,5.07) 9.02,5.2 8.67,5.55 arc(8.09,5.93) 7.42,6.07 6.68,6.07 arc(6.36,6.13) 6.09,6.31
UP_VCC: length 15
  Top Layer w0.254: U2.26 v1(29.72,8.2)
  Bottom Layer w0.381: v1(29.72,8.2) 31.88,10.36 31.88,19.78 31.69,19.96 Q2.2
UP_VCC_EN: length 10.3
  Top Layer w0.152: v1(30.99,22.32) 33.02,22.32 v1(33.4,22.7)
  Bottom Layer w0.152: 27.66,23.02 29.52,23.02 30.23,22.32 v1(30.99,22.32) ; v1(33.4,22.7) 35.87,22.7 Q3.1
$1N442: length 4.2
  Top Layer w0.152: U2.9 35.66,5.2 36.83,4.03 37.43,4.03 38.46,3 R26.2
$1N469: length 3.1
  Top Layer w0.254: C36.1 28.83,11.54 U2.24
$1N1150: length 2.7
  Bottom Layer w0.254: LED11.2 36.83,13.69 R44.1
$1N18923: length 2
  Bottom Layer w0.254: R39.1 17.76,28.07 LED13.2
$1N18990: length 2
  Bottom Layer w0.254: LED12.2 R40.1
$1N41303: length 3.3
  Top Layer w0.254: U29.5 16.64,25.62 16.27,25.99 R43.2
$1N58947: length 3.1
  Bottom Layer w0.152: U34.7 37.97,5.29 38.36,5.68 38.36,6.06 38.61,6.31 38.98,6.31 R63.1
$1N58951: length 3.8
  Bottom Layer w0.152: U34.3 40.62,4.79 41.02,4.39 41.02,3.9 40.01,2.88 R62.2
$2N12685: length 6.1
  Top Layer w0.152: U33.27 24.91,6.69 25.4,6.69 25.56,6.86 25.56,7.51 ; 25.56,8.3 25.56,7.83 ; 25.56,8.3 25.56,8.31 U33.31 ; 25.56,8.3 25.56,8.84 25.29,9.11 U33.33 ; 25.56,7.83 26.29,7.83 26.29,7.83 R52.2 ; 25.56,7.83 25.56,7.51 ; 25.56,7.51 25.56,7.51 U33.29
$2N12693: length 2
  Top Layer w0.254: LED15.2 R54.1
$2N12701: length 6.2
  Top Layer w0.152: R55.1 v1(15.15,13.04) ; U33.49 v1(18.59,11.39)
  Bottom Layer w0.152: v1(18.59,11.39) 17.31,11.39 15.66,13.04 v1(15.15,13.04)
$2N12705: length 8
  Top Layer w0.152: U33.45 20.19,10.68 v1(19.97,10.9) ; v1(15.47,14.12) 15.02,14.56 R56.1
  Bottom Layer w0.152: v1(19.97,10.9) 18.97,11.89 17.69,11.89 v1(15.47,14.12)
$2N12808: length 4.6
  Top Layer w0.142: U33.59 16.63,6.71 arc(16.6,6.71) 16.57,6.73 arc(16.55,6.75) 16.52,6.75 15.85,6.75 arc(15.63,6.66) 15.54,6.44 15.54,5.27 arc(15.38,4.88) 14.99,4.72 arc(14.81,4.68) 14.65,4.58 C75.2
$2N12812: length 4.6
  Top Layer w0.142: C74.2 14.65,5.15 arc(14.81,5.05) 14.99,5.01 arc(15.17,5.09) 15.24,5.27 15.24,6.44 arc(15.42,6.88) 15.86,7.06 16.52,7.06 arc(16.55,7.07) 16.57,7.08 arc(16.6,7.1) 16.63,7.11 U33.58
$2N12880: length 6.4
  Top Layer w0.142: U33.51 17.79,10.65 arc(17.8,10.69) 17.82,10.71 arc(17.84,10.74) 17.84,10.78 17.84,11.02 arc(17.81,11.11) 17.72,11.15 17.59,11.15 arc(17.5,11.19) 17.46,11.28 arc(17.5,11.37) 17.59,11.4 17.72,11.4 arc(17.81,11.44) 17.84,11.53 arc(17.71,11.87) 17.37,12 17.27,12 arc(16.96,11.94) 16.69,11.76 15.42,10.49 arc(15.24,10.37) 15.03,10.33 14.92,10.33 arc(14.81,10.31) 14.73,10.25 C103.2
$2N12884: length 6.3
  Top Layer w0.142: C102.2 14.75,10.68 arc(14.81,10.64) 14.89,10.62 15.03,10.62 arc(15.13,10.64) 15.21,10.7 16.49,11.97 arc(16.85,12.21) 17.27,12.3 17.37,12.3 arc(17.92,12.07) 18.14,11.53 18.14,10.78 arc(18.15,10.74) 18.17,10.71 arc(18.19,10.69) 18.19,10.65 U33.50
$2N14097: length 4.4
  Top Layer w0.142: U33.15 23.39,2.13 arc(23.43,1.94) 23.54,1.78 23.74,1.58 arc(24,1.4) 24.31,1.34 26.15,1.34 arc(26.62,1.25) C105.1
$2N14098: length 4.4
  Top Layer w0.142: U33.16 23.79,2.05 arc(23.81,1.95) 23.87,1.86 23.95,1.79 arc(24.11,1.68) 24.31,1.64 25.21,1.64 arc(25.3,1.67) 25.34,1.76 25.34,1.87 arc(25.47,2) 25.59,1.87 25.59,1.76 arc(25.63,1.67) 25.72,1.64 26.15,1.64 arc(26.62,1.73) C104.1
$2N14147: length 2.3
  Top Layer w0.142: U33.18 arc(24.96,3.15) 25.03,3.16 25.32,3.16 arc(25.68,3.23) 25.99,3.44 arc(26.06,3.48) 26.14,3.5 26.15,3.5 arc(26.62,3.41) C107.1
$2N14148: length 2.3
  Top Layer w0.142: U33.19 arc(24.96,3.47) 25.03,3.45 25.32,3.45 arc(25.57,3.5) 25.78,3.65 arc(25.95,3.76) 26.14,3.79 26.15,3.79 arc(26.62,3.89) C106.1
$2N16031: length 10.2
  Top Layer w0.152: U33.40 22.19,11.05 v1(22.22,11.08)
  Top Layer w0.254: v1(17.15,16.22) 17.14,16.23 15.62,16.23
  Bottom Layer w0.152: v1(22.22,11.08) 22.22,12.16 18.16,16.22 v1(17.15,16.22)
$2N16694: length 17.2
  Top Layer w0.152: v1(22.77,11.02) 22.59,10.83 U33.39 ; R64.1 20.68,19.16 20.99,19.16 21.09,19.27 21.09,19.3 22.1,20.3 v1(22.1,20.66)
  Bottom Layer w0.152: v1(22.77,11.02) 22.77,12.12 20.7,14.19 20.7,17.24 19.82,18.12 19.52,18.12 19.31,18.34 19.31,20.41 19.42,20.52 21.95,20.52 v1(22.1,20.66)

## Copper pours and planes (outline as drawn; the poured copper is in the pictures)
+5V on Top Layer: 23.67,13.12 25.99,13.12 25.99,9.86 23.67,9.86
+5V on 内层2: 0.26,33.69 59.75,33.69 59.75,0.26 0.26,0.26
GND on Top Layer: -3.81,37.05 45.84,37.05 45.84,-1.05 -3.81,-1.05
GND on Bottom Layer: -2.82,35.93 45.82,35.93 45.82,-0.62 -2.82,-0.62
GND on 内层1: 0.26,33.69 59.75,33.69 59.75,0.26 0.26,0.26
VCC on Bottom Layer: 19.56,20.03 22.77,20.03 22.77,18.48 19.56,18.48
HUB_1V2 on Top Layer: 21.88,16.44 26.65,16.44 26.65,13.53 21.88,13.53
HUB_3V3 on Top Layer: 24.07,10.57 27.42,10.57 27.42,8.75 24.07,8.75
$2N12665 on Top Layer: 21.88,12.78 24.17,12.78 24.17,9.86 21.88,9.86

Small or netless copper shapes (teardrops, artwork), in the pictures only: 456 on Top Layer, 281 on Bottom Layer, 35 on 内层1, 4 on 内层2

## Text on the board
Bottom Silkscreen Layer: CERN-OHL-S-2.0 / wychlw/RemoSwitch | HOST / DUT | SD / GOOD | RemoSwitch / v0.9.0-b
Top Silkscreen Layer: PON | T R G | JLCJLCJLCJLC
